# Altium schematic sheet fuelGauge.SchDoc
size A4; SheetNumber: 14; SheetTotal: 15
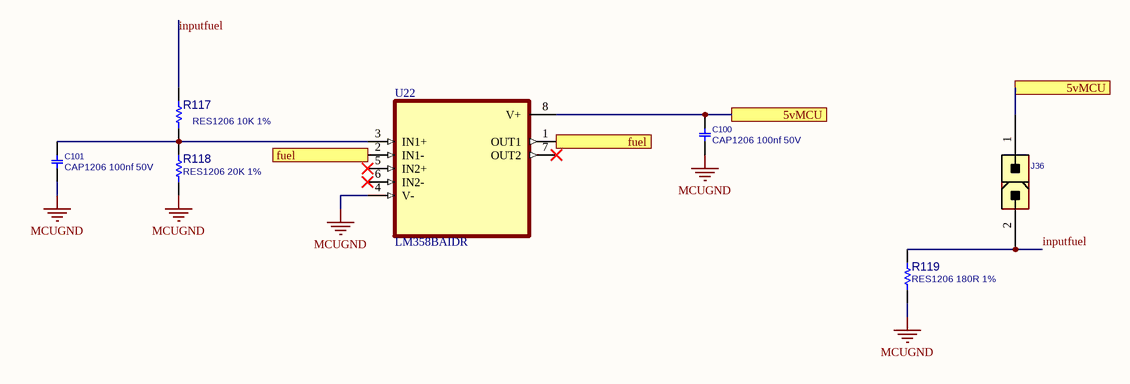
[diagram p0: fuelGauge.SchDoc]

## Parts
C100  CAP1206 100nf 50V  [C1206]
C101  CAP1206 100nf 50V  [C1206]
J36  CONN_ATXPWR_2  [ATXPWR_2]  (value not drawn)
R117  RES1206 10K 1%  [R1206]
R118  RES1206 20K 1%  [R1206]
R119  RES1206 180R 1%  [R1206]
U22  LM358BAIDR  [SOIC127P599X175-8N]

## Ports
5vMCU, fuel

## Nets
MCUGND: C100.1 C101.2 R118.1 R119.1 U22.4(V-)
5vMCU: C100.2 J36.1 U22.8(V+) ; port 5vMCU
fuel: U22.1(OUT1) U22.2(IN1-) ; port fuel
inputfuel: J36.2 R117.2 R119.2
NetC101_1: C101.1 R117.1 R118.2 U22.3(IN1+)

Not connected (* = marked no-connect by the designer): U22 5(IN2+)* 6(IN2-)* 7(OUT2)*

## Library data of the parts
C100 C101 = CAP_SMD_MLCC_1206: CAP, MLCC; PARAM: -, -%; MANF_P#: MANF_PART#; PARAM2: -V; PRICE: 100= 1$; MANF: -; ASSEMBLY: ASSEMBLY
J36 = CONN_ATXPWR_2: CONN, ATX POWER, 2 P; MANF: Molex; MANF_P#: 39281023; VALUE: CONN_ATXPWR_2; MountType: THD; PACKAGE: ATXPWR-2pin; Part Type: Conn.
R117-R119 = RES_SMD_1206: RESISTOR, SMD; PARAM: 1%, 0.25W; DESC: DESCRIPTION; DIST#: MOUSER; MANF_P#: -; MANF: -; ASSEMBLY: ASSEMBLY; PRICE: -; PARAM2: -
U22 = LM358BAIDR: Dual, 36-V, 1.2-MHz, 2-mV offset voltage operational amplifier; MF: Texas Instruments; SnapEDA_Link: https://www.snapeda.com/parts/LM358BAIDR/Texas+Instruments/view-part/?ref=snap; Package: SOIC-8 Texas Instruments; Value: *; MP: LM358BAIDR; Check_prices: https://www.snapeda.com/parts/LM358BAIDR/Texas+Instruments/view-part/?ref=eda